# Altium schematic sheet RK3566_VO_SHEET_2.SchDoc
size A4; SheetNumber: 16; SheetTotal: 23
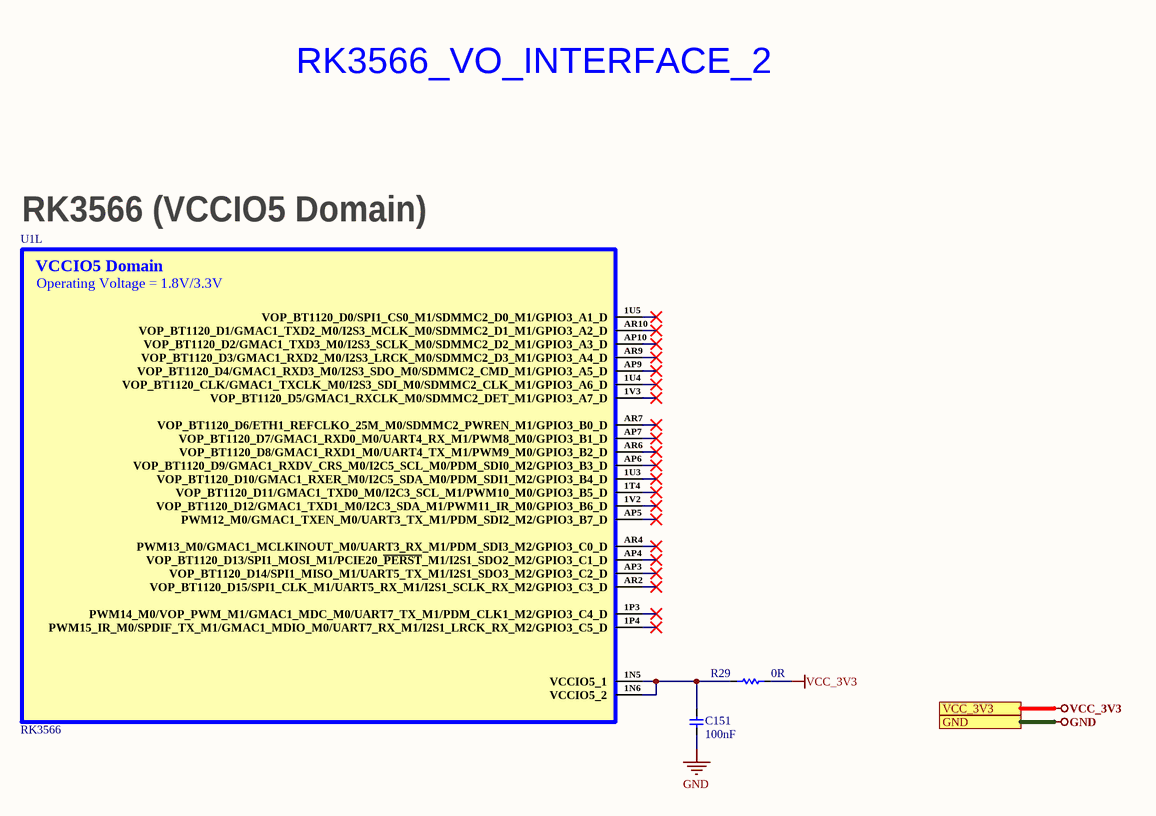
[diagram p0: RK3566_VO_SHEET_2.SchDoc]

## Parts
C151  100nF  [CAP-0201]
R29  0R  [Res-0402]
U1  RK3566  [BGA-565(15.5x14.4)]  (part L of 22)

## Ports
GND (see DRAM_LPDDR4_SHEET[6D], eMMC_SPI-FLASH_SHEET[1D], HDMI2.0_SHEET[3D], POWER_LDO_SHEET[3D], POWER_OTHER_SHEET[3C], POWER_PMIC_RK809_CODEC[3C], POWER_PMIC_RK809_DC DC[3D], POWER_PMIC_RK809_LDO[4C], POWER_PMIC_RK809_MGM[3D], RK3566_AUDIO_SHEET[3C], RK3566_DDR-PHY_SHEET[5D], RK3566_FLASH-SD_SHEET[4C], RK3566_OSC_PMUIO_SHEET[5D], RK3566_POWER_SHEET[3D], RK3566_SARADC_GPIO[3D], RK3566_USB_PCIe_SHEET[3D], RK3566_VI_SHEET[3D], RK3566_VO_SHEET_1[3C], TYPE-C_INTERFACE_SHEET[3D], TYPE-C_TO_MIPI-CSI_SHEET[5D], USB2.0_SHEET[3D], WIFI-6_SHEET[3D]), VCC_3V3 (see eMMC_SPI-FLASH_SHEET[1D], HDMI2.0_SHEET[3D], POWER_PMIC_RK809_LDO[4C], RK3566_AUDIO_SHEET[3C], RK3566_SARADC_GPIO[3D], RK3566_USB_PCIe_SHEET[3D], RK3566_VI_SHEET[3D], TYPE-C_TO_MIPI-CSI_SHEET[5D], WIFI-6_SHEET[3D])

## Nets
GND: C151.1 ; port GND
VCC_3V3: R29.2 ; port VCC_3V3
NetC151_2: C151.2 R29.1 U1.1N5(VCCIO5_1) U1.1N6(VCCIO5_2)

Not connected (* = marked no-connect by the designer): U1 1P3(PWM14_M0/VOP_PWM_M1/GMAC1_MDC_M0/UART7_TX_M1/PDM_CLK1_M2/GPIO3_C4_D)* 1P4(PWM15_IR_M0/SPDIF_TX_M1/GMAC1_MDIO_M0/UART7_RX_M1/I2S1_LRCK_RX_M2/GPIO3_C5_D)* 1T4(VOP_BT1120_D11/GMAC1_TXD0_M0/I2C3_SCL_M1/PWM10_M0/GPIO3_B5_D)* 1U3(VOP_BT1120_D10/GMAC1_RXER_M0/I2C5_SDA_M0/PDM_SDI1_M2/GPIO3_B4_D)* 1U4(VOP_BT1120_CLK/GMAC1_TXCLK_M0/I2S3_SDI_M0/SDMMC2_CLK_M1/GPIO3_A6_D)* 1U5(VOP_BT1120_D0/SPI1_CS0_M1/SDMMC2_D0_M1/GPIO3_A1_D)* 1V2(VOP_BT1120_D12/GMAC1_TXD1_M0/I2C3_SDA_M1/PWM11_IR_M0/GPIO3_B6_D)* 1V3(VOP_BT1120_D5/GMAC1_RXCLK_M0/SDMMC2_DET_M1/GPIO3_A7_D)* AP3(VOP_BT1120_D14/SPI1_MISO_M1/UART5_TX_M1/I2S1_SDO3_M2/GPIO3_C2_D)* AP4(VOP_BT1120_D13/SPI1_MOSI_M1/PCIE20_~{PERST}_M1/I2S1_SDO2_M2/GPIO3_C1_D)* AP5(PWM12_M0/GMAC1_TXEN_M0/UART3_TX_M1/PDM_SDI2_M2/GPIO3_B7_D)* AP6(VOP_BT1120_D9/GMAC1_RXDV_CRS_M0/I2C5_SCL_M0/PDM_SDI0_M2/GPIO3_B3_D)* AP7(VOP_BT1120_D7/GMAC1_RXD0_M0/UART4_RX_M1/PWM8_M0/GPIO3_B1_D)* AP9(VOP_BT1120_D4/GMAC1_RXD3_M0/I2S3_SDO_M0/SDMMC2_CMD_M1/GPIO3_A5_D)* AP10(VOP_BT1120_D2/GMAC1_TXD3_M0/I2S3_SCLK_M0/SDMMC2_D2_M1/GPIO3_A3_D)* AR2(VOP_BT1120_D15/SPI1_CLK_M1/UART5_RX_M1/I2S1_SCLK_RX_M2/GPIO3_C3_D)* AR4(PWM13_M0/GMAC1_MCLKINOUT_M0/UART3_RX_M1/PDM_SDI3_M2/GPIO3_C0_D)* AR6(VOP_BT1120_D8/GMAC1_RXD1_M0/UART4_TX_M1/PWM9_M0/GPIO3_B2_D)* AR7(VOP_BT1120_D6/ETH1_REFCLKO_25M_M0/SDMMC2_PWREN_M1/GPIO3_B0_D)* AR9(VOP_BT1120_D3/GMAC1_RXD2_M0/I2S3_LRCK_M0/SDMMC2_D3_M1/GPIO3_A4_D)* AR10(VOP_BT1120_D1/GMAC1_TXD2_M0/I2S3_MCLK_M0/SDMMC2_D1_M1/GPIO3_A2_D)*

## Notes on the sheet
- RK3566_VO_INTERFACE_2
- RK3566 (VCCIO5 Domain)
- File:
- Title:
- Date:
- Page
- Num:
- Total:
- Drawn By: Huzaifa Ali
- (in symbol RK3566, part L) VCCIO5 Domain; Operating Voltage = 1.8V/3.3V

## Library data of the parts
C151 = CC0201KRX5R6BB104: CAP CER 0.1UF 10V X5R 0201; Manufacturer: Yageo; Tolerance: 10%; Supplier 1: Mouser; Manufacturer Part Number: CC0201KRX5R6BB104; RoHS: Yes; Category: Ceramic Capacitors; Stock 1: 824403; Pricing 1: 1=0.10000, 10=0.02400, 50=0.02400, 100=0.01900, 1000=0.01100, 10000=0.00900 (USD); Mount: Surface Mount; Case/Package: 0201; Case Code (Imperial): 0201; Case Code (Metric): 0603; Weight: 6E-06oz; Min Operating Temperature: -55°C; Max Operating Temperature: 85°C; Capacitance: 100nF; Dielectric: X5R; Voltage Rating (DC): 10V; Packaging: Tape and Reel; Termination: SMD/SMT; Resistor Type: Ceramic; Voltage Rating: 10V; Series: CC; Construction: Flat; Length: 0.6mm; Width: 0.012inch; Height: 0.3mm; Thickness: 0.013inch; Depth: 0.3mm; Radiation Hardening: No; Lead Free: Lead Free; Halogen Free: Halogen Free; RoHS Compliant: Yes; ComponentLink1URL: https://datasheet.ciiva.com/11587/upy-gphc-x5r-4v-to-50v-12-11587190.pdf?src-supplier=Avnet; ComponentLink1Description: https://datasheet.ciiva.com/11587/upy-gphc-x5r-4v-to-50v-12-11587190.pdf?src-supplier=Avnet; Supplier Part Number 1: 603-CC201KRX5R6BB104; LCSC Part Number: C190183
R29 = RC0402FR-070RL: RES 0 OHM JUMPER 1/16W 0402; Manufacturer: Yageo; Item Type: Resistors; Tolerance: 1%; Power Rating: 62.5mW; Voltage Rating: 50V; Temperature Coefficient: 200ppm/°C; Max Power Dissipation: 63mW; Supplier 1: Mouser; Manufacturer Part Number: RC0402FR-070RL; RoHS: Yes; Stock 1: 8556842; Pricing 1: 1=0.10000, 10=0.01400, 50=0.01400, 100=0.00600, 1000=0.00300, 5000=0.00200, 10000=0.00100 (USD); Mount: Surface Mount; Case/Package: 0402; Contact Plating: Tin,Matte; Case Code (Imperial): 0402; Case Code (Metric): 1005; Size Code: 0402; Min Operating Temperature: -55°C; Max Operating Temperature: 155°C; Resistance: 0R; Resistor Type: Thick Film; Packaging: Tape and Reel; Termination: SMD/SMT; Features: Moisture Resistant; Series: RC; Number of Terminations: 2; Length: 1mm; Width: 0.5mm; Height: 0.35mm; Radiation Hardening: No; Lead Free: Lead Free; RoHS Compliant: Yes; ComponentLink1URL: https://datasheet.ciiva.com/8896/pyu-rc0402-51-rohs-l-6-8896149.pdf?src-supplier=Avnet; ComponentLink1Description: https://datasheet.ciiva.com/8896/pyu-rc0402-51-rohs-l-6-8896149.pdf?src-supplier=Avnet; ComponentLink2URL: https://datasheet.ciiva.com/16790/pyu-rc0402-51-rohs-l-6-r-16790444.pdf?src-supplier=Future+Electronics; ComponentLink2Description: https://datasheet.ciiva.com/16790/pyu-rc0402-51-rohs-l-6-r-16790444.pdf?src-supplier=Future+Electronics; Supplier Part Number 1: 603-RC0402FR-070RL; LCSC Part Number: C106231
U1 = RK3566: BGA-565(15.5x14.4) Microcontrollers (MCU/MPU/SOC) ROHS; Manufacturer: Rockchip; Item Type: IC; Manufacturer Part Number: RK3566; Package: BGA-565(15.5x14.4); LCSC Part Number: C2943786; ComponentLink1Description: LCSC; ComponentLink1URL: https://www.lcsc.com/product-detail/Microcontrollers-MCU-MPU-SOC_Rockchip-RK3566_C2943786.html